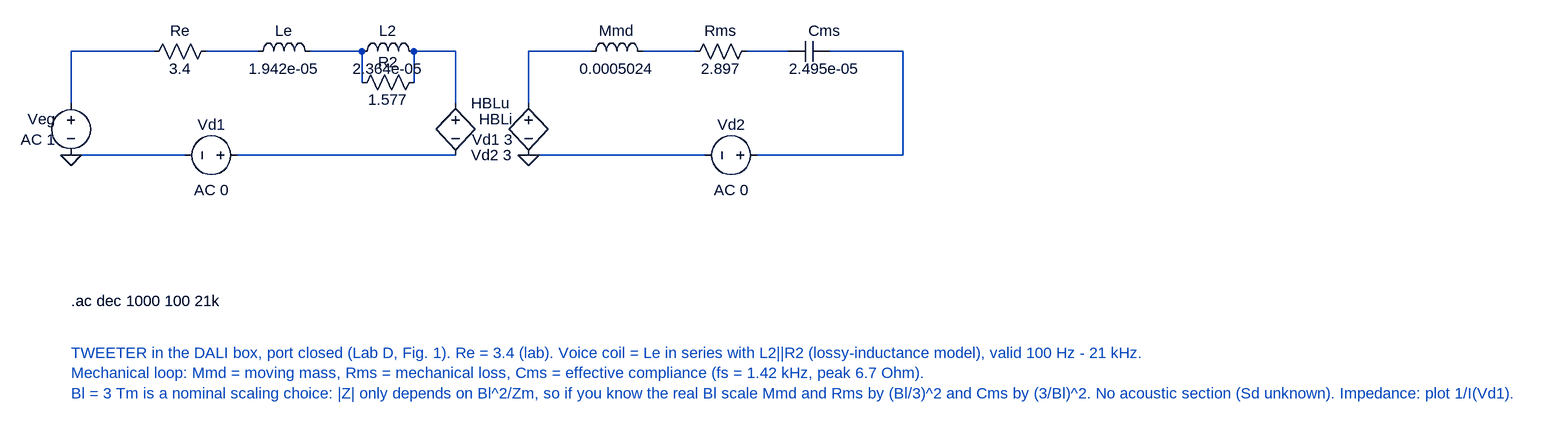
[diagram p0: schematic Tweeter_DALI_box.asc]
Tweeter_DALI_box.asc, the LTspice schematic file:
Version 4.1
SHEET 1 1600 700
WIRE 128 -144 0 -144
WIRE 288 -144 208 -144
WIRE 448 -144 368 -144
WIRE 448 -96 448 -144
WIRE 528 -144 528 -96
WIRE 592 -144 528 -144
WIRE 592 -64 592 -144
WIRE 800 -144 704 -144
WIRE 960 -144 880 -144
WIRE 1104 -144 1040 -144
WIRE 1280 -144 1168 -144
WIRE 0 -64 0 -144
WIRE 704 -64 704 -144
WIRE 1280 16 1280 -144
WIRE 176 16 0 16
WIRE 592 16 256 16
WIRE 976 16 704 16
WIRE 1280 16 1056 16
FLAG 0 16 0
FLAG 704 16 0
SYMBOL voltage 0 -80 R0
WINDOW 0 -24 40 Right 2
WINDOW 3 -24 72 Right 2
WINDOW 123 -24 72 Right 2
SYMATTR InstName Veg
SYMATTR Value ""
SYMATTR Value2 AC 1
SYMBOL res 112 -128 R270
WINDOW 0 32 56 VTop 2
WINDOW 3 5 56 VBottom 2
SYMATTR InstName Re
SYMATTR Value 3.4
SYMBOL ind 272 -128 R270
WINDOW 0 32 56 VTop 2
WINDOW 3 5 56 VBottom 2
SYMATTR InstName Le
SYMATTR Value 1.942e-05
SYMATTR SpiceLine Rser=1p
SYMBOL ind 432 -128 R270
WINDOW 0 32 56 VTop 2
WINDOW 3 5 56 VBottom 2
SYMATTR InstName L2
SYMATTR Value 2.364e-05
SYMATTR SpiceLine Rser=1p
SYMBOL res 432 -80 R270
WINDOW 0 32 56 VTop 2
WINDOW 3 5 56 VBottom 2
SYMATTR InstName R2
SYMATTR Value 1.577
SYMBOL h 592 -80 R0
WINDOW 123 24 44 Left 2
SYMATTR InstName HBLu
SYMATTR Value Vd2 3
SYMBOL voltage 272 16 R90
WINDOW 0 -32 56 VBottom 2
WINDOW 3 32 56 VTop 2
WINDOW 123 69 56 VBottom 2
WINDOW 39 0 0 Left 0
SYMATTR InstName Vd1
SYMATTR Value ""
SYMATTR Value2 AC 0
SYMBOL h 704 -80 R0
WINDOW 0 -24 40 Right 2
WINDOW 3 -24 72 Right 2
WINDOW 123 -24 72 Right 2
SYMATTR InstName HBLi
SYMATTR Value Vd1 3
SYMBOL ind 784 -128 R270
WINDOW 0 32 56 VTop 2
WINDOW 3 5 56 VBottom 2
SYMATTR InstName Mmd
SYMATTR Value 0.0005024
SYMATTR SpiceLine Rser=1p
SYMBOL res 944 -128 R270
WINDOW 0 32 56 VTop 2
WINDOW 3 5 56 VBottom 2
SYMATTR InstName Rms
SYMATTR Value 2.897
SYMBOL cap 1104 -128 R270
WINDOW 0 32 56 VTop 2
WINDOW 3 5 56 VBottom 2
SYMATTR InstName Cms
SYMATTR Value 2.495e-05
SYMBOL voltage 1072 16 R90
WINDOW 0 -32 56 VBottom 2
WINDOW 3 32 56 VTop 2
WINDOW 123 69 56 VBottom 2
WINDOW 39 0 0 Left 0
SYMATTR InstName Vd2
SYMATTR Value ""
SYMATTR Value2 AC 0
TEXT 0 240 Left 2 !.ac dec 1000 100 21k
TEXT 0 320 Left 2 ;TWEETER in the DALI box, port closed (Lab D, Fig. 1). Re = 3.4 (lab). Voice coil = Le in series with L2||R2 (lossy-inductance model), valid 100 Hz - 21 kHz.\nMechanical loop: Mmd = moving mass, Rms = mechanical loss, Cms = effective compliance (fs = 1.42 kHz, peak 6.7 Ohm).\nBl = 3 Tm is a nominal scaling choice: |Z| only depends on Bl^2/Zm, so if you know the real Bl scale Mmd and Rms by (Bl/3)^2 and Cms by (3/Bl)^2. No acoustic section (Sd unknown). Impedance: plot 1/I(Vd1).

The netlist it stands for:
* Tweeter_DALI_box.asc
Veg N001 0 AC 1
Re N001 N002 3.4
Le N002 N003 1.942e-05 Rser=1p
L2 N003 N004 2.364e-05 Rser=1p
R2 N003 N004 1.577
HBLu N004 N009 Vd2 3
Vd1 N009 0 AC 0
HBLi N005 0 Vd1 3
L§Mmd N005 N006 0.0005024 Rser=1p
Rms N006 N007 2.897
Cms N007 N008 2.495e-05
Vd2 N008 0 AC 0
.ac dec 1000 100 21k
* TWEETER in the DALI box, port closed (Lab D, Fig. 1). Re = 3.4 (lab). Voice coil = Le in series with L2||R2 (lossy-inductance model), valid 100 Hz - 21 kHz.
* Mechanical loop: Mmd = moving mass, Rms = mechanical loss, Cms = effective compliance (fs = 1.42 kHz, peak 6.7 Ohm).
* Bl = 3 Tm is a nominal scaling choice: |Z| only depends on Bl^2/Zm, so if you know the real Bl scale Mmd and Rms by (Bl/3)^2 and Cms by (3/Bl)^2. No acoustic section (Sd unknown). Impedance: plot 1/I(Vd1).
.backanno
.end